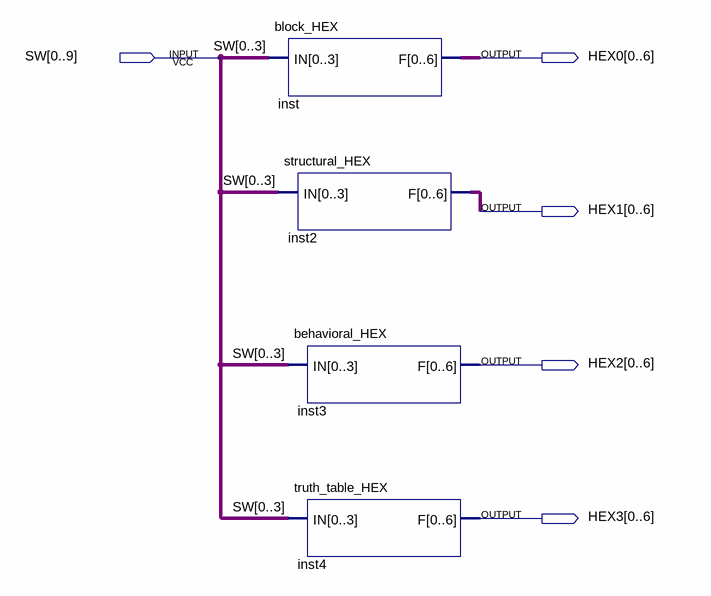
[diagram p0: schematic sheet]
// Quartus schematic lab5.bdf as structural Verilog: 4 symbols, 5 pins
module lab5 (
  input  [0:9] SW,
  output [0:6] HEX0,
  output [0:6] HEX1,
  output [0:6] HEX2,
  output [0:6] HEX3
);

  block_HEX inst (.IN(SW[0:3]), .F(HEX0));
  structural_HEX inst2 (.IN(SW[0:3]), .F(HEX1));
  behavioral_HEX inst3 (.IN(SW[0:3]), .F(HEX2));
  truth_table_HEX inst4 (.IN(SW[0:3]), .F(HEX3));
endmodule
